# Altium project Force_Measurement_Device_PCB.PrjPcb
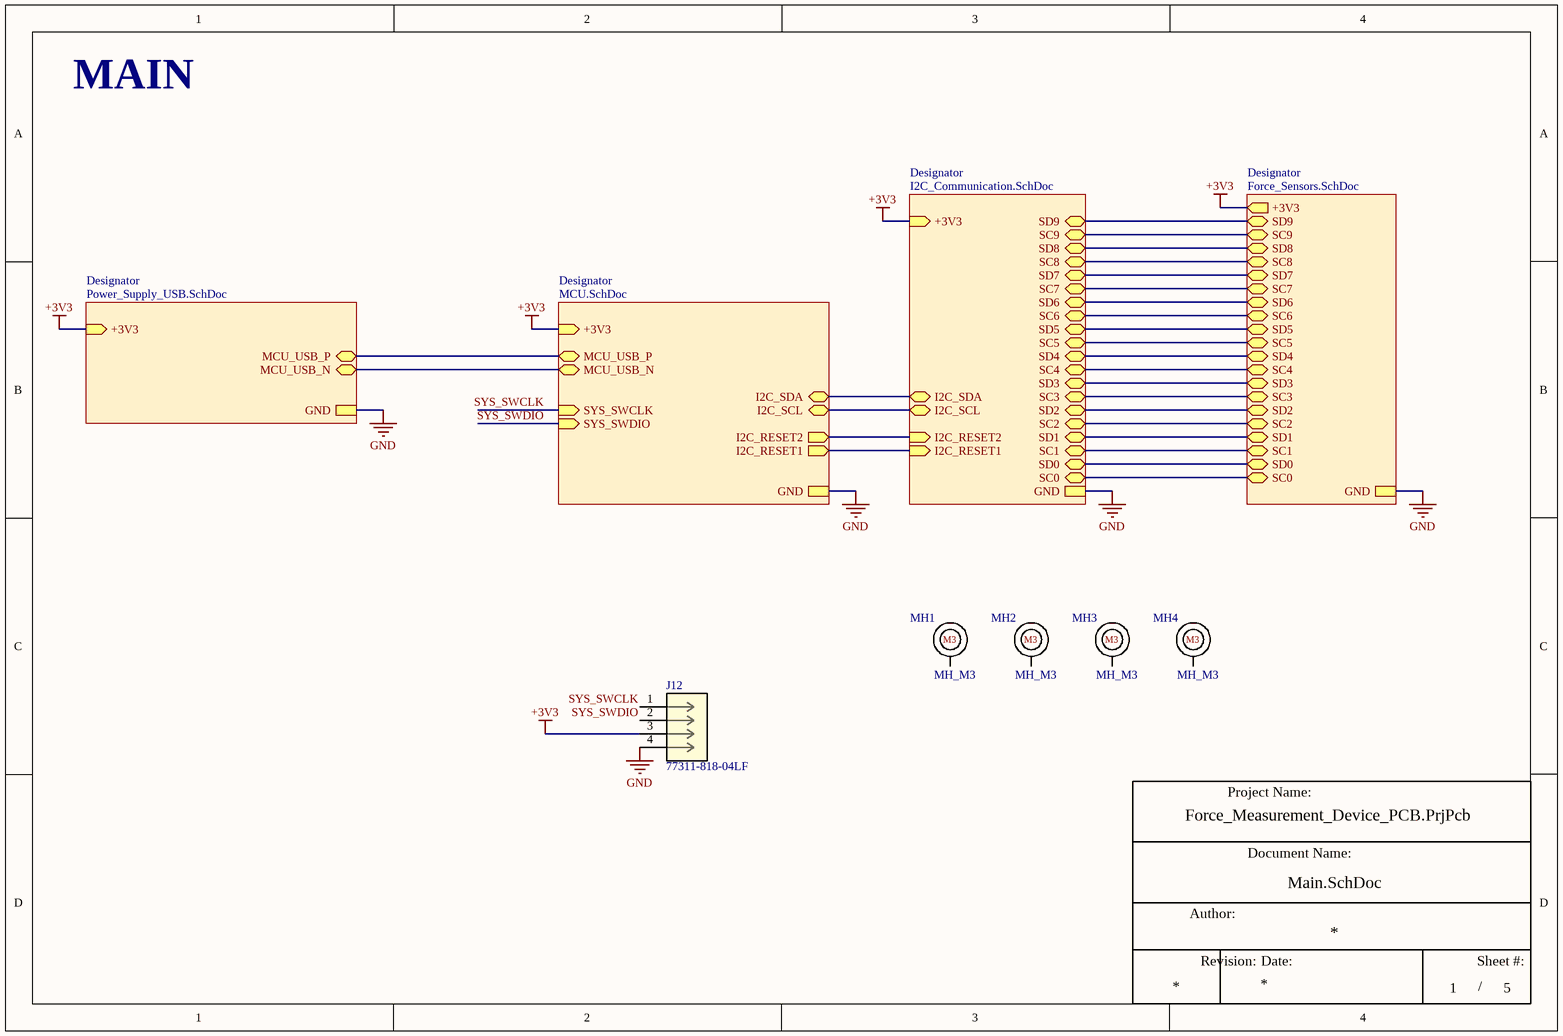
[diagram p0: Main.SchDoc]
CAGE_CODE: ?????; CONTRACT_NUMBER: <CONTRACT NO>; DOC_NO_ASSY_DWG: <ASSY DWG NO>; DOC_NO_BOM: <BOM DOC NO>; DOC_NO_FAB_DWG: <FAB DWG NO>; DOC_NO_SCH_DWG: <SCH DWG NO>; PCB_2_DEC_TOL: +/-.01; PCB_3_DEC_TOL: +/-.010; PCB_ANG_TOL: +/-1/2; PCB_ASSEMBLY_NO: <PCB ASSY NO>; PCB_CHECKER: - -----; PCB_CHECKER_APP_DATE: --/--/----; PCB_DESIGNER: - -----; PCB_DESIGNER_APP_DATE: --/--/----; PCB_DWG_NO: <PCB DWG NO>; PCB_ENGINEER: - -----; PCB_ENGINEER_APP_DATE: --/--/----; PCB_PART_NUMBER: <PCB PN>; PCB_REV: A; SCH_REV: A
5 sheets, 117 parts. Net scope: strictly hierarchical (ports join the sheet entries above them; power ports are local).
Board file: PCB1.PcbDoc
Sheets:
  Main.SchDoc
    Designator = Force_Sensors.SchDoc
    Designator = Power_Supply_USB.SchDoc
    Designator = MCU.SchDoc
    Designator = I2C_Communication.SchDoc

## Sheet Main.SchDoc
size A4; SheetNumber: 1; SheetTotal: 5

### Parts
J12  77311-818-04LF  [77311-818-04LF_AMP]
MH1  MH_M3  [M3]  (no BOM)
MH2  MH_M3  [M3]  (no BOM)
MH3  MH_M3  [M3]  (no BOM)
MH4  MH_M3  [M3]  (no BOM)

### Sub-sheets
Designator = Force_Sensors.SchDoc: GND, +3V3 (out), SC9 (bidir), SD8 (bidir), SC8 (bidir), SD7 (bidir), SC7 (bidir), SD6 (bidir), SC6 (bidir), SD5 (bidir), SC5 (bidir), SD4 (bidir), SC4 (bidir), SD3 (bidir), SC3 (bidir), SD2 (bidir), SC2 (bidir), SD1 (bidir), SC1 (bidir), SD0 (bidir), SC0 (bidir), SD9 (bidir)
Designator = Power_Supply_USB.SchDoc: GND, +3V3 (in), MCU_USB_P (bidir), MCU_USB_N (bidir)
Designator = MCU.SchDoc: I2C_SDA (bidir), I2C_SCL (bidir), SYS_SWCLK (in), +3V3 (in), SYS_SWDIO (in), I2C_RESET1 (out), I2C_RESET2 (out), GND, MCU_USB_P (bidir), MCU_USB_N (bidir)
Designator = I2C_Communication.SchDoc: GND, +3V3 (in), I2C_SDA (bidir), I2C_SCL (bidir), I2C_RESET2 (in), I2C_RESET1 (in), SC9 (bidir), SD8 (bidir), SC8 (bidir), SD2 (bidir), SD7 (bidir), SC3 (bidir), SD3 (bidir), SC4 (bidir), SD4 (bidir), SC5 (bidir), SD5 (bidir), SC6 (bidir), SD6 (bidir), SC7 (bidir), SC2 (bidir), SD1 (bidir), SC1 (bidir), SD0 (bidir), SC0 (bidir), SD9 (bidir)

### Nets
+3V3: J12.3 ; sheet Designator/+3V3, sheet Designator/+3V3, sheet Designator/+3V3, sheet Designator/+3V3
GND: J12.4 ; sheet Designator/GND, sheet Designator/GND, sheet Designator/GND, sheet Designator/GND
I2C_RESET1: sheet Designator/I2C_RESET1, sheet Designator/I2C_RESET1
I2C_RESET2: sheet Designator/I2C_RESET2, sheet Designator/I2C_RESET2
I2C_SCL: sheet Designator/I2C_SCL, sheet Designator/I2C_SCL
I2C_SDA: sheet Designator/I2C_SDA, sheet Designator/I2C_SDA
MCU_USB_N: sheet Designator/MCU_USB_N, sheet Designator/MCU_USB_N
MCU_USB_P: sheet Designator/MCU_USB_P, sheet Designator/MCU_USB_P
SC0: sheet Designator/SC0, sheet Designator/SC0
SC1: sheet Designator/SC1, sheet Designator/SC1
SC2: sheet Designator/SC2, sheet Designator/SC2
SC3: sheet Designator/SC3, sheet Designator/SC3
SC4: sheet Designator/SC4, sheet Designator/SC4
SC5: sheet Designator/SC5, sheet Designator/SC5
SC6: sheet Designator/SC6, sheet Designator/SC6
SC7: sheet Designator/SC7, sheet Designator/SC7
SC8: sheet Designator/SC8, sheet Designator/SC8
SC9: sheet Designator/SC9, sheet Designator/SC9
SD0: sheet Designator/SD0, sheet Designator/SD0
SD1: sheet Designator/SD1, sheet Designator/SD1
SD2: sheet Designator/SD2, sheet Designator/SD2
SD3: sheet Designator/SD3, sheet Designator/SD3
SD4: sheet Designator/SD4, sheet Designator/SD4
SD5: sheet Designator/SD5, sheet Designator/SD5
SD6: sheet Designator/SD6, sheet Designator/SD6
SD7: sheet Designator/SD7, sheet Designator/SD7
SD8: sheet Designator/SD8, sheet Designator/SD8
SD9: sheet Designator/SD9, sheet Designator/SD9
SYS_SWCLK: J12.1 ; sheet Designator/SYS_SWCLK
SYS_SWDIO: J12.2 ; sheet Designator/SYS_SWDIO

Not connected (* = marked no-connect by the designer): MH1 1; MH2 1; MH3 1; MH4 1

### Notes on the sheet
- MAIN
- Project Name:
- Author:
- Document Name:
- Revision:
- Date:
- Sheet #:
- /

### Library data of the parts
J12 = 77311-818-04LF: Description; Manufacturer_Name: Amphenol ICC; Copyright: Copyright (C) 2025 Ultra Librarian. All rights reserved.; Manufacturer_Part_Number: 77311-818-04LF; RefDes: RefDes; Type: Type
MH1-MH4 = CMP-00028-00002-1: Mounting hole; M3 Screw; 3.4mm x 4.3mm; Revision Num.: 1; Man. Part Num.: M3; Diameter: 4.3mm; Hole size: 3.4mm

## Sheet Force_Sensors.SchDoc
size A4; SheetNumber: 4; SheetTotal: 5
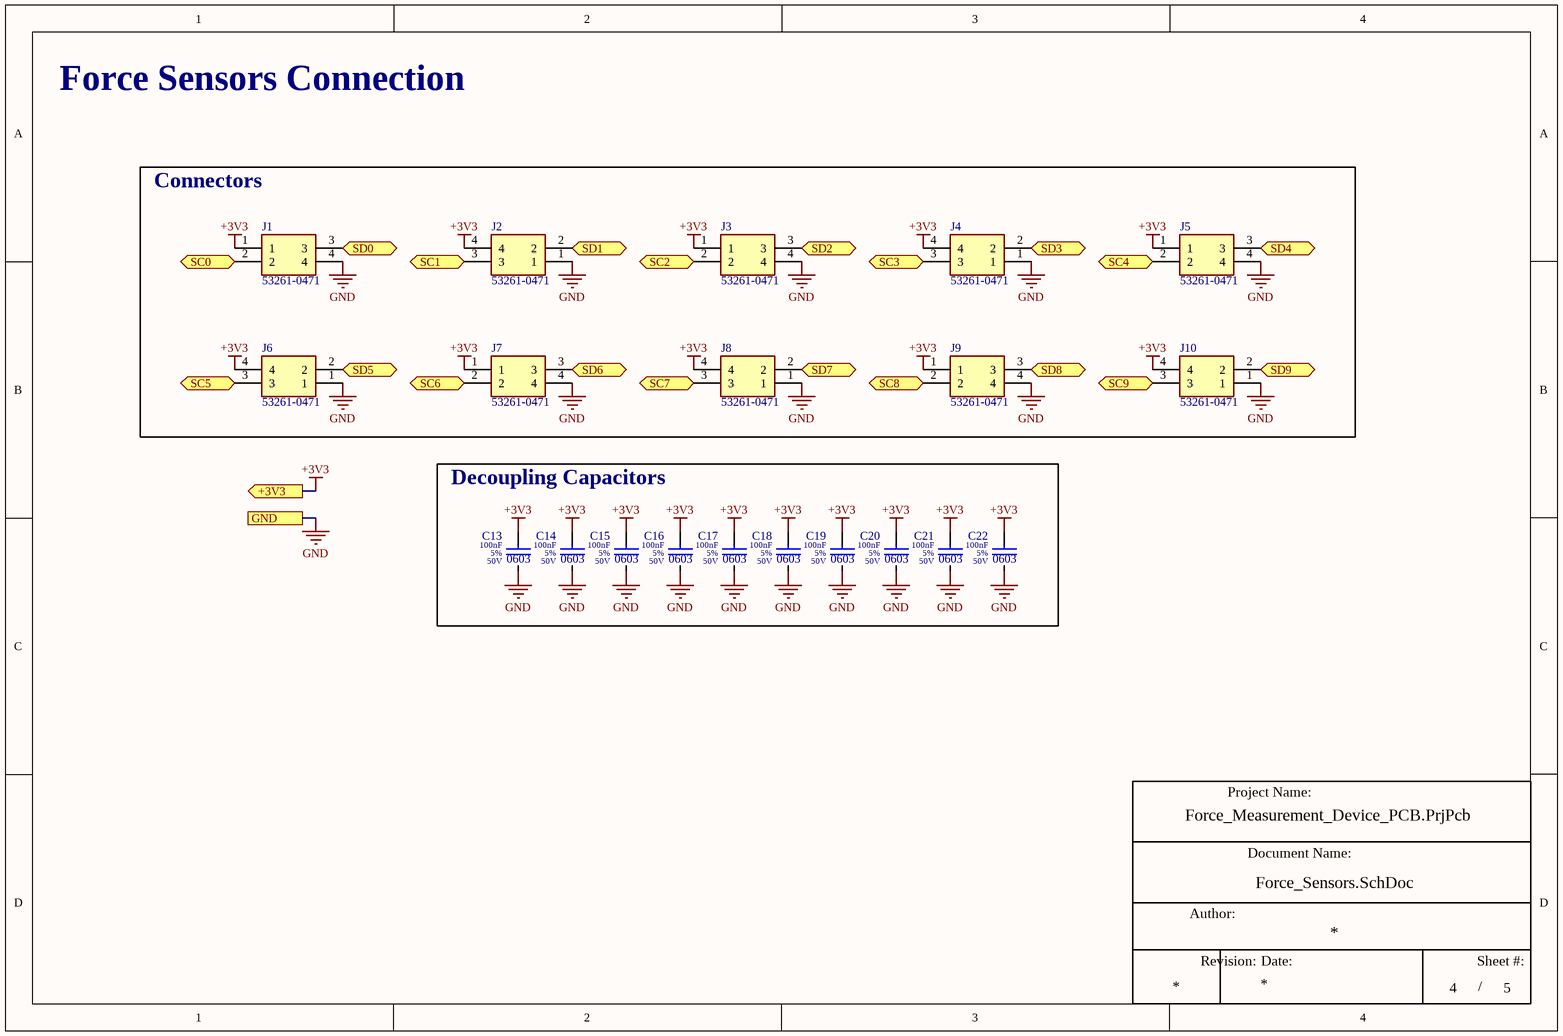
[diagram p1: Force_Sensors.SchDoc]

### Parts
C13  value 100nF  Tolerance: 5%  Voltage Rating: 50V  Case/Package: 0603  [0603_Capacitor]  (hidden comment: C_100n_50V_0603_5)
C14  value 100nF  Tolerance: 5%  Voltage Rating: 50V  Case/Package: 0603  [0603_Capacitor]  (hidden comment: C_100n_50V_0603_5)
C15  value 100nF  Tolerance: 5%  Voltage Rating: 50V  Case/Package: 0603  [0603_Capacitor]  (hidden comment: C_100n_50V_0603_5)
C16  value 100nF  Tolerance: 5%  Voltage Rating: 50V  Case/Package: 0603  [0603_Capacitor]  (hidden comment: C_100n_50V_0603_5)
C17  value 100nF  Tolerance: 5%  Voltage Rating: 50V  Case/Package: 0603  [0603_Capacitor]  (hidden comment: C_100n_50V_0603_5)
C18  value 100nF  Tolerance: 5%  Voltage Rating: 50V  Case/Package: 0603  [0603_Capacitor]  (hidden comment: C_100n_50V_0603_5)
C19  value 100nF  Tolerance: 5%  Voltage Rating: 50V  Case/Package: 0603  [0603_Capacitor]  (hidden comment: C_100n_50V_0603_5)
C20  value 100nF  Tolerance: 5%  Voltage Rating: 50V  Case/Package: 0603  [0603_Capacitor]  (hidden comment: C_100n_50V_0603_5)
C21  value 100nF  Tolerance: 5%  Voltage Rating: 50V  Case/Package: 0603  [0603_Capacitor]  (hidden comment: C_100n_50V_0603_5)
C22  value 100nF  Tolerance: 5%  Voltage Rating: 50V  Case/Package: 0603  [0603_Capacitor]  (hidden comment: C_100n_50V_0603_5)
J1  53261-0471  [53261-0471]
J2  53261-0471  [53261-0471]
J3  53261-0471  [53261-0471]
J4  53261-0471  [53261-0471]
J5  53261-0471  [53261-0471]
J6  53261-0471  [53261-0471]
J7  53261-0471  [53261-0471]
J8  53261-0471  [53261-0471]
J9  53261-0471  [53261-0471]
J10  53261-0471  [53261-0471]

### Blocks framed on the sheet
Connectors: J1-J10
Decoupling Capacitors: C13-C22

### Ports
+3V3 (out), GND, SC0 (bidir), SC1 (bidir), SC2 (bidir), SC3 (bidir), SC4 (bidir), SC5 (bidir), SC6 (bidir), SC7 (bidir), SC8 (bidir), SC9 (bidir), SD0 (bidir), SD1 (bidir), SD2 (bidir), SD3 (bidir), SD4 (bidir), SD5 (bidir), SD6 (bidir), SD7 (bidir), SD8 (bidir), SD9 (bidir)

### Nets
+3V3: C13.1 C14.1 C15.1 C16.1 C17.1 C18.1 C19.1 C20.1 C21.1 C22.1 J1.1 J2.4 J3.1 J4.4 J5.1 J6.4 J7.1 J8.4 J9.1 J10.4 ; port +3V3
GND: C13.2 C14.2 C15.2 C16.2 C17.2 C18.2 C19.2 C20.2 C21.2 C22.2 J1.4 J2.1 J3.4 J4.1 J5.4 J6.1 J7.4 J8.1 J9.4 J10.1 ; port GND
SC0: J1.2 ; port SC0
SC1: J2.3 ; port SC1
SC2: J3.2 ; port SC2
SC3: J4.3 ; port SC3
SC4: J5.2 ; port SC4
SC5: J6.3 ; port SC5
SC6: J7.2 ; port SC6
SC7: J8.3 ; port SC7
SC8: J9.2 ; port SC8
SC9: J10.3 ; port SC9
SD0: J1.3 ; port SD0
SD1: J2.2 ; port SD1
SD2: J3.3 ; port SD2
SD3: J4.2 ; port SD3
SD4: J5.3 ; port SD4
SD5: J6.2 ; port SD5
SD6: J7.3 ; port SD6
SD7: J8.2 ; port SD7
SD8: J9.3 ; port SD8
SD9: J10.2 ; port SD9

### Notes on the sheet
- Force Sensors Connection
- Project Name:
- Author:
- Document Name:
- Revision:
- Date:
- Sheet #:
- /

### Library data of the parts
C13-C22 = CMP-001-00008-27: Capacitor Type: Ceramic; Revision Num.: 1; HelpURL: https://www.tme.eu/Document/78f46414e6dac38b7cca12338ea208b0/X7RDielectric.pdf; Mounting Technology: SMT
J1-J10 = 53261-0471: Connector; Manufacturer_Name: Molex; Datasheet Link: http://www.molex.com/webdocs/datasheets/pdf/en-us//0532610471_PCB_HEADERS.pdf; Manufacturer_Part_Number: 53261-0471; Mouser Part Number: 538-53261-0471; Mouser Price/Stock: https://www.mouser.co.uk/ProductDetail/Molex/53261-0471?qs=%252B72YyncTwW9e3et3PwnEMw%3D%3D; Arrow Part Number: 53261-0471; Arrow Price/Stock: null?region=nac

## Sheet Power_Supply_USB.SchDoc
size A4; SheetNumber: 5; SheetTotal: 5
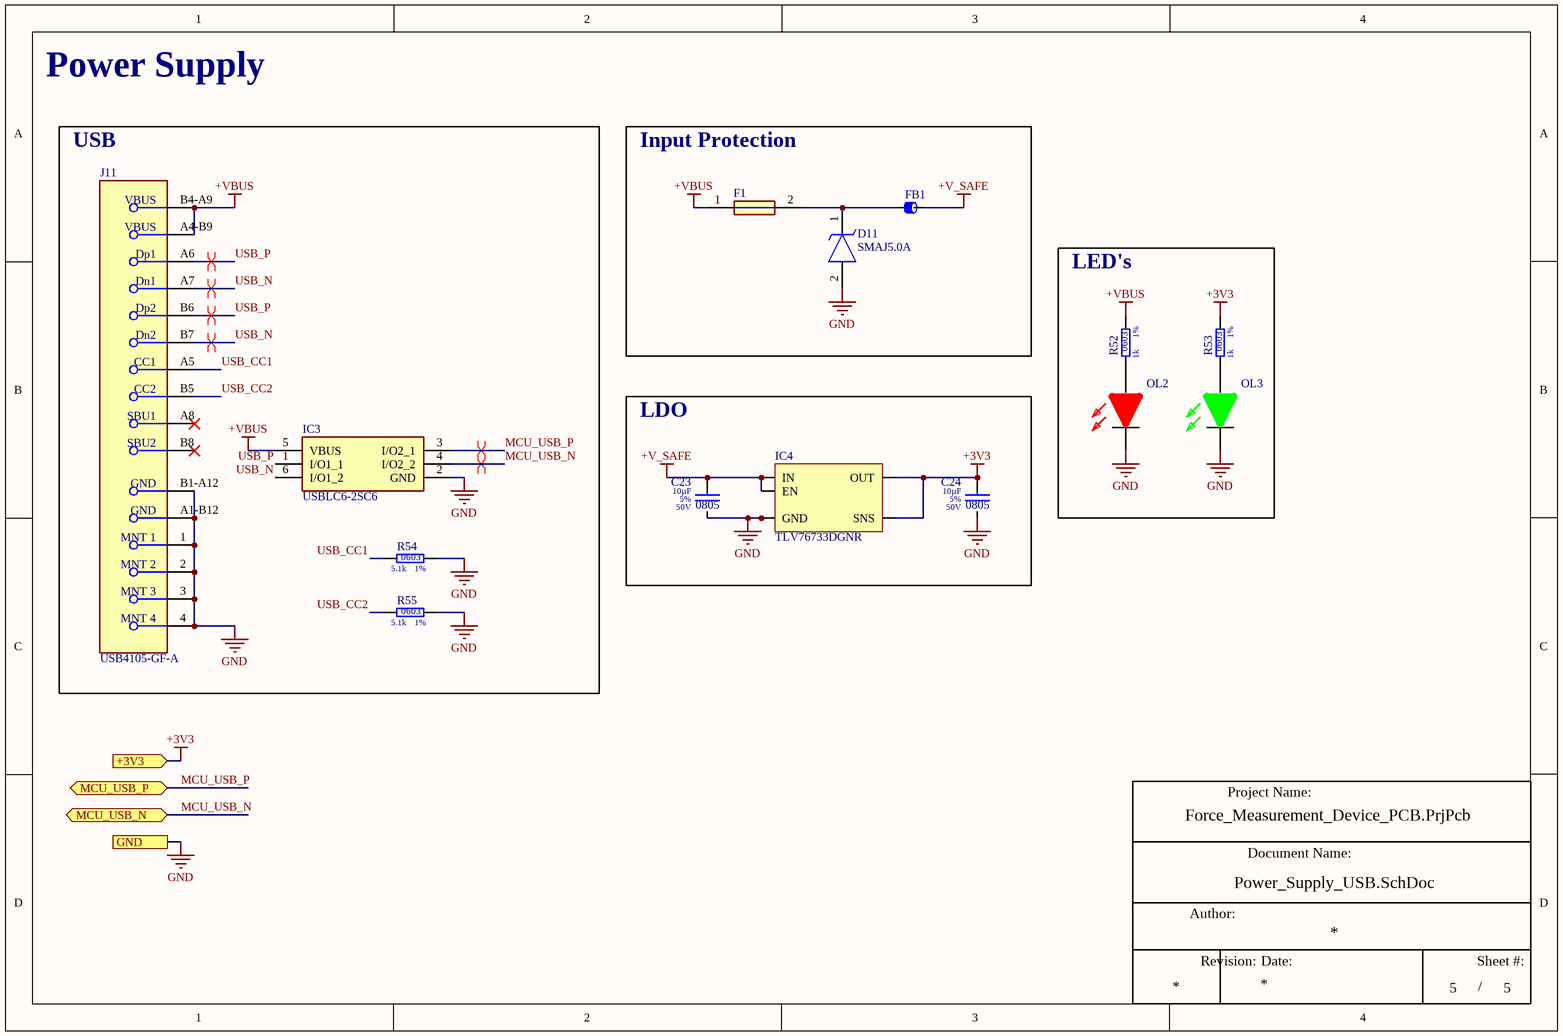
[diagram p2: Power_Supply_USB.SchDoc]

### Parts
C23  value 10µF  Tolerance: 5%  Voltage Rating: 50V  Case/Package: 0805  [0805_Capacitor]  (hidden comment: C_10u_50V_0805_10)
C24  value 10µF  Tolerance: 5%  Voltage Rating: 50V  Case/Package: 0805  [0805_Capacitor]  (hidden comment: C_10u_50V_0805_10)
D11  SMAJ5.0A  [DIOM5226X243N]
F1  1206L050_15YR  [FUSC3216X75N]  (value not drawn)
FB1  MPZ1608S601ATA00  [BEADC1608X75N]  (value not drawn)
IC3  USBLC6-2SC6  [SOT95P280X145-6N]
IC4  TLV76733DGNR  [SOP65P490X110-9N]
J11  USB4105-GF-A  [USB_C]
OL2  SML-LX0603SIW-TR  [LEDC1608X60N]  (value not drawn)
OL3  SML-LX0603GW-TR  [LEDC1608X60N]  (value not drawn)
R52  Tolerance: 1%  Resistance: 1k  Case/Package: 0603  [0603_Resistor]  (hidden comment: R_1k_0603_1)
R53  Tolerance: 1%  Resistance: 1k  Case/Package: 0603  [0603_Resistor]  (hidden comment: R_1k_0603_1)
R54  Tolerance: 1%  Resistance: 5.1k  Case/Package: 0603  [0603_Resistor]  (hidden comment: R_5k1_0603_5)
R55  Tolerance: 1%  Resistance: 5.1k  Case/Package: 0603  [0603_Resistor]  (hidden comment: R_5k1_0603_5)

### Blocks framed on the sheet
USB: IC3 J11 R54 R55
Input Protection: D11 F1 FB1
LED's: OL2 OL3 R52 R53
LDO: C23 C24 IC4

### Ports
+3V3 (in), GND, MCU_USB_N (bidir), MCU_USB_P (bidir)

### Nets
+3V3: C24.1 IC4.1(OUT) IC4.2(SNS) R53.2 ; port +3V3
+V_SAFE: C23.1 FB1.2 IC4.5(EN) IC4.8(IN)
+VBUS: F1.1 IC3.5(VBUS) J11.A4-B9(VBUS) J11.B4-A9(VBUS) R52.2
GND: C23.2 C24.2 D11.2(A) IC3.2(GND) IC4.4(GND_2) IC4.6(GND) IC4.9(EP) J11.1(MNT_1) J11.2(MNT_2) J11.3(MNT_3) J11.4(MNT_4) J11.A1-B12(GND) J11.B1-A12(GND) OL2.1(K) OL3.1(K) R54.2 R55.2 ; port GND
MCU_USB_N: IC3.4(I/O2_2) ; port MCU_USB_N
MCU_USB_P: IC3.3(I/O2_1) ; port MCU_USB_P
USB_CC1: J11.A5(CC1) R54.1
USB_CC2: J11.B5(CC2) R55.1
USB_N: IC3.6(I/O1_2) J11.A7(Dn1) J11.B7(Dn2)
USB_P: IC3.1(I/O1_1) J11.A6(Dp1) J11.B6(Dp2)
NetD11_1: D11.1(K) F1.2 FB1.1
NetOL2_2: OL2.2(A) R52.1
NetOL3_2: OL3.2(A) R53.1

Not connected (* = marked no-connect by the designer): J11 A8(SBU1)* B8(SBU2)*

### Layout directives
differential pair: MCU_USB_N, MCU_USB_P, USB_N, USB_P

### Notes on the sheet
- Power Supply
- Project Name:
- Author:
- Document Name:
- Revision:
- Date:
- Sheet #:
- /

### Library data of the parts
C23 C24 = CMP-001-00003-17: Man. Part Num.: GRM21BR61H106KE43L; Revision Num.: 1; Capacitor Type: Ceramic; HelpURL: https://www.mouser.pl/datasheet/2/281/1/GRM21BR61H106KE43_01A-1986884.pdf; Mounting Technology: SMT
D11 = SMAJ5.0A: TVS Diode (Uni-directional); Manufacturer_Name: Kyocera AVX; Datasheet Link: http://datasheets.kyocera-avx.com/tvsdiodes.pdf; Height: 2.43mm; Manufacturer_Part_Number: SMAJ5.0A; Mouser Part Number: 581-SMAJ5.0A; Mouser Price/Stock: https://www.mouser.co.uk/ProductDetail/KYOCERA-AVX/SMAJ5.0A?qs=tuYJFV7zqWuCnk6fJgfdVg%3D%3D; Arrow Part Number: SMAJ5.0A; Arrow Price/Stock: null?region=nac
F1 = 1206L050_15YR: Fuse; Manufacturer_Name: Wickmann; Manufacturer_Part_Number: 1206L050/15YR; Datasheet Link: https://docs.rs-online.com/8c7c/0900766b81637964.pdf; Height: 0.75mm
FB1 = MPZ1608S601ATA00: Ferrite Bead; Manufacturer_Name: TDK; Datasheet Link: https://product.tdk.com/system/files/dam/doc/product/emc/emc/beads/catalog/beads_commercial_power_mpz1608_en.pdf; Height: 0.75mm; Manufacturer_Part_Number: MPZ1608S601ATA00; Mouser Part Number: 810-MPZ1608S601ATA00; Mouser Price/Stock: https://www.mouser.co.uk/ProductDetail/TDK/MPZ1608S601ATA00?qs=47dIwT2ZIzth0CTKDYh9rw%3D%3D; Arrow Part Number: MPZ1608S601ATA00; Arrow Price/Stock: https://www.arrow.com/en/products/mpz1608s601ata00/tdk.html?utm_currency=USD&region=europe
IC3 = USBLC6-2SC6: Integrated Circuit; Manufacturer_Name: STMicroelectronics; Datasheet Link: https://www.st.com/resource/en/datasheet/usblc6-2.pdf; Height: 1.45mm; Manufacturer_Part_Number: USBLC6-2SC6; Mouser Part Number: 511-USBLC6-2SC6; Mouser Price/Stock: https://www.mouser.co.uk/ProductDetail/STMicroelectronics/USBLC6-2SC6?qs=po45yt2pPpu%2FhNIlwQdTlg%3D%3D; Arrow Part Number: USBLC6-2SC6; Arrow Price/Stock: https://www.arrow.com/en/products/usblc6-2sc6/stmicroelectronics?utm_currency=USD&region=europe
IC4 = TLV76733DGNR: Integrated Circuit; Manufacturer_Name: Texas Instruments; Datasheet Link: https://www.ti.com/lit/ds/symlink/tlv767.pdf?ts=1601893180135&ref_url=https%253A%252F%252Fduckduckgo.com%252F; Height: 1.1mm; Manufacturer_Part_Number: TLV76733DGNR; Mouser Part Number: 595-TLV76733DGNR; Mouser Price/Stock: https://www.mouser.co.uk/ProductDetail/Texas-Instruments/TLV76733DGNR?qs=W%2FMpXkg%252BdQ7WCurh%2FfEdlw%3D%3D; Arrow Part Number: TLV76733DGNR; Arrow Price/Stock: https://www.arrow.com/en/products/tlv76733dgnr/texas-instruments?utm_currency=USD&region=nac
J11 = USB_C: USB Connector Type-C, 16 Contact(s), Female, Right Angle, SMT, USB 2.0
OL2 = SML-LX0603SIW-TR: LED; Manufacturer_Name: Lumex; Datasheet Link: https://www.lumex.com/led-smd-0603.html; Height: 0.6mm; Manufacturer_Part_Number: SML-LX0603SIW-TR; Mouser Part Number: 696-SML-LX0603SIW; Mouser Price/Stock: https://www.mouser.co.uk/ProductDetail/Lumex/SML-LX0603SIW-TR?qs=lPH1AmYLb0ytkrMTawxMgQ%3D%3D; Arrow Part Number: SML-LX0603SIW-TR; Arrow Price/Stock: https://www.arrow.com/en/products/sml-lx0603siw-tr/lumex?utm_currency=USD&region=nac
OL3 = SML-LX0603GW-TR: LED; Manufacturer_Name: Lumex; Datasheet Link: https://www.lumex.com/datasheet/SML-LX0603GW-TR; Height: 0.727mm; Manufacturer_Part_Number: SML-LX0603GW-TR; Mouser Part Number: N/A; Mouser Price/Stock: https://www.mouser.com/Search/Refine.aspx?Keyword=N%2FA; Arrow Part Number: SML-LX0603GW-TR; Arrow Price/Stock: https://www.arrow.com/en/products/sml-lx0603gw-tr/lumex?utm_currency=USD&region=nac
R52 R53 = CMP-009-00099-4: Revision Num.: 1; Voltage Rating: 75V; Power: 100mW; HelpURL: https://www.tme.eu/Document/622e28308c06d160637f2b14751ba16b/Data%20Sheet%20CRCW_BCe3.pdf; Mounting Technology: SMT
R54 R55 = CMP-009-00017-19: Revision Num.: 1; Power: 100mW; Voltage Rating: 50V; HelpURL: https://www.mouser.pl/datasheet/2/54/cr-1858361.pdf; Mounting Technology: SMT

## Sheet MCU.SchDoc
size A4; SheetNumber: 2; SheetTotal: 5; ENG_APP_DATE: --/--/--; DSN_APP_DATE: --/--/--; CHK_APP_DATE: --/--/--
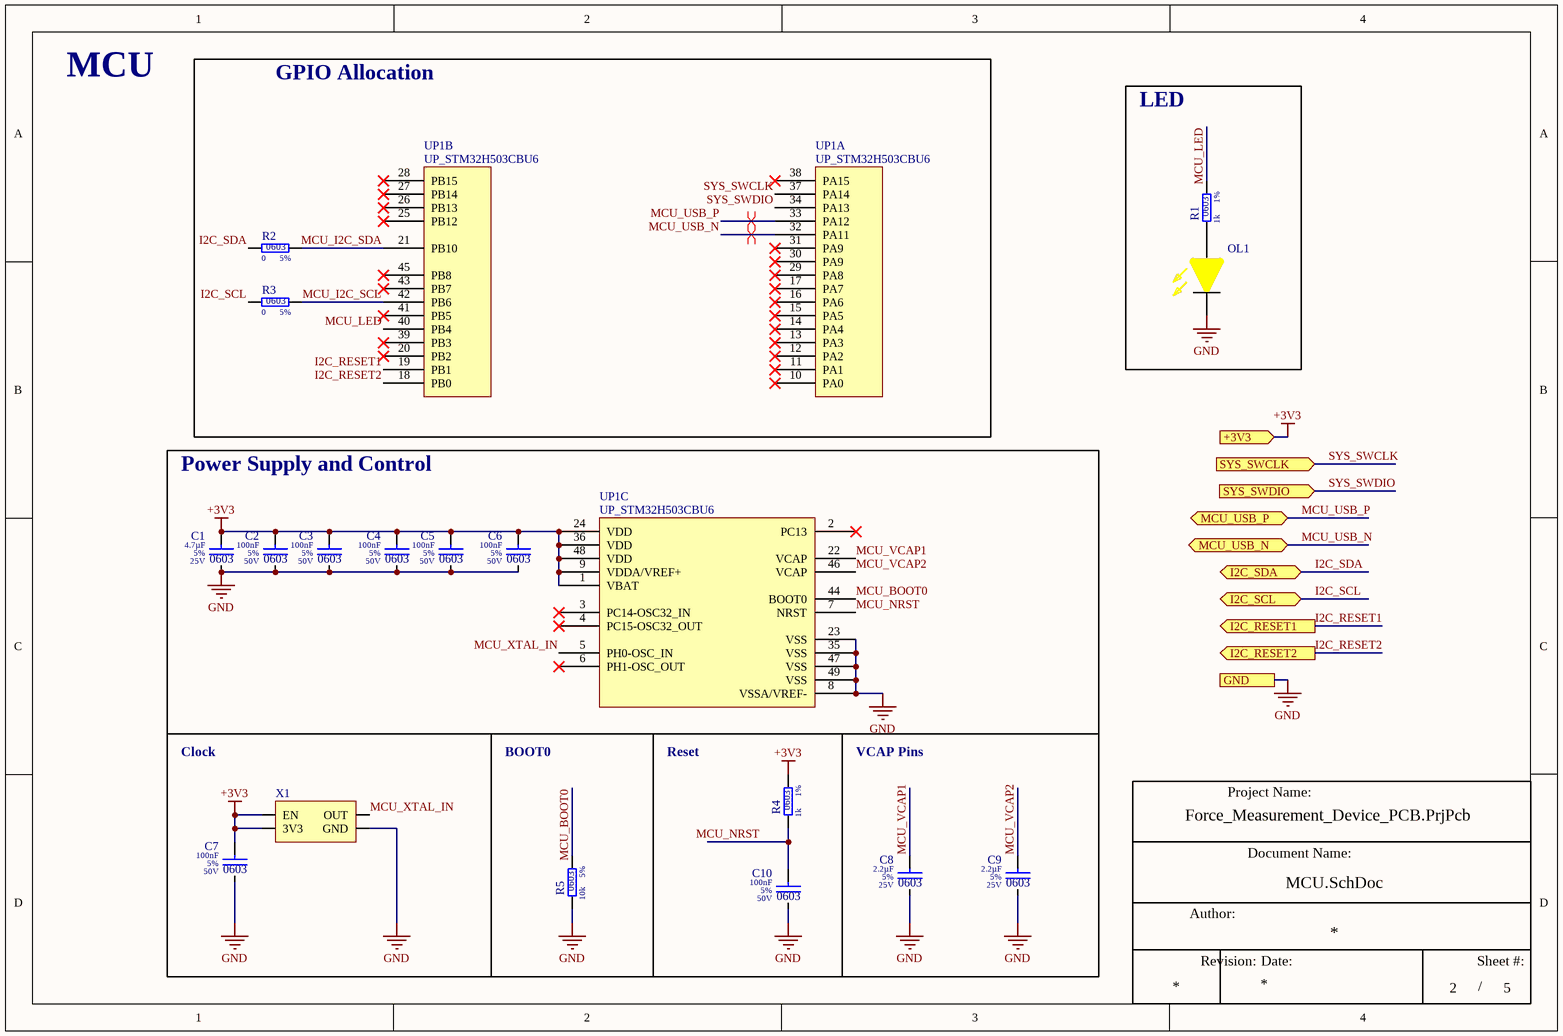
[diagram p3: MCU.SchDoc]

### Parts
C1  value 4.7µF  Tolerance: 5%  Voltage Rating: 25V  Case/Package: 0603  [0603_Capacitor]  (hidden comment: C_4.7u_25V_0603_5)
C2  value 100nF  Tolerance: 5%  Voltage Rating: 50V  Case/Package: 0603  [0603_Capacitor]  (hidden comment: C_100n_50V_0603_5)
C3  value 100nF  Tolerance: 5%  Voltage Rating: 50V  Case/Package: 0603  [0603_Capacitor]  (hidden comment: C_100n_50V_0603_5)
C4  value 100nF  Tolerance: 5%  Voltage Rating: 50V  Case/Package: 0603  [0603_Capacitor]  (hidden comment: C_100n_50V_0603_5)
C5  value 100nF  Tolerance: 5%  Voltage Rating: 50V  Case/Package: 0603  [0603_Capacitor]  (hidden comment: C_100n_50V_0603_5)
C6  value 100nF  Tolerance: 5%  Voltage Rating: 50V  Case/Package: 0603  [0603_Capacitor]  (hidden comment: C_100n_50V_0603_5)
C7  value 100nF  Tolerance: 5%  Voltage Rating: 50V  Case/Package: 0603  [0603_Capacitor]  (hidden comment: C_100n_50V_0603_5)
C8  value 2.2µF  Tolerance: 5%  Voltage Rating: 25V  Case/Package: 0603  [0603_Capacitor]  (hidden comment: C_2.2u_25V_0603_5)
C9  value 2.2µF  Tolerance: 5%  Voltage Rating: 25V  Case/Package: 0603  [0603_Capacitor]  (hidden comment: C_2.2u_25V_0603_5)
C10  value 100nF  Tolerance: 5%  Voltage Rating: 50V  Case/Package: 0603  [0603_Capacitor]  (hidden comment: C_100n_50V_0603_5)
OL1  SML-LX0603SYW-TR  [LEDC1608X60N]  (value not drawn)
R1  Tolerance: 1%  Resistance: 1k  Case/Package: 0603  [0603_Resistor]  (hidden comment: R_1k_0603_1)
R2  Tolerance: 5%  Resistance: 0  Case/Package: 0603  [0603_Resistor]  (hidden comment: R_0_0603_5)
R3  Tolerance: 5%  Resistance: 0  Case/Package: 0603  [0603_Resistor]  (hidden comment: R_0_0603_5)
R4  Tolerance: 1%  Resistance: 1k  Case/Package: 0603  [0603_Resistor]  (hidden comment: R_1k_0603_1)
R5  Tolerance: 5%  Resistance: 10k  Case/Package: 0603  [0603_Resistor]  (hidden comment: R_10k_0603_5)
UP1  UP_STM32H503CBU6  [UFQFPN48]  (parts A,B,C of 3)
X1  X_16MHz_LFSPXO066657CUTT  [X_2mm_2.5mm_oscillator]  (value not drawn)

### Blocks framed on the sheet
GPIO Allocation: R2 R3 UP1
LED: OL1 R1
Power Supply and Control: C1-C10 R4 R5 UP1 X1

### Ports
+3V3 (in), GND, I2C_RESET1 (out), I2C_RESET2 (out), I2C_SCL (bidir), I2C_SDA (bidir), MCU_USB_N (bidir), MCU_USB_P (bidir), SYS_SWCLK (in), SYS_SWDIO (in)

### Nets
+3V3: C1.1 C2.1 C3.1 C4.1 C5.1 C6.1 C7.1 R4.2 UP1.1(VBAT) UP1.9(VDDA/VREF+) UP1.24(VDD) UP1.36(VDD) UP1.48(VDD) X1.1(EN) X1.4(3V3) ; port +3V3
GND: C1.2 C2.2 C3.2 C4.2 C5.2 C6.2 C7.2 C8.2 C9.2 C10.2 OL1.1(K) R5.1 UP1.8(VSSA/VREF-) UP1.23(VSS) UP1.35(VSS) UP1.47(VSS) UP1.49(VSS) X1.2(GND) ; port GND
I2C_RESET1: UP1.19(PB1) ; port I2C_RESET1
I2C_RESET2: UP1.18(PB0) ; port I2C_RESET2
I2C_SCL: R3.1 ; port I2C_SCL
I2C_SDA: R2.1 ; port I2C_SDA
MCU_BOOT0: R5.2 UP1.44(BOOT0)
MCU_I2C_SCL: R3.2 UP1.42(PB6)
MCU_I2C_SDA: R2.2 UP1.21(PB10)
MCU_LED: R1.2 UP1.40(PB4)
MCU_NRST: C10.1 R4.1 UP1.7(NRST)
MCU_USB_N: UP1.32(PA11) ; port MCU_USB_N
MCU_USB_P: UP1.33(PA12) ; port MCU_USB_P
MCU_VCAP1: C8.1 UP1.22(VCAP)
MCU_VCAP2: C9.1 UP1.46(VCAP)
MCU_XTAL_IN: UP1.5(PH0-OSC_IN) X1.3(OUT)
SYS_SWCLK: UP1.37(PA14) ; port SYS_SWCLK
SYS_SWDIO: UP1.34(PA13) ; port SYS_SWDIO
NetOL1_2: OL1.2(A) R1.1

Not connected (* = marked no-connect by the designer): UP1 2(PC13)* 3(PC14-OSC32_IN)* 4(PC15-OSC32_OUT)* 6(PH1-OSC_OUT)* 10(PA0)* 11(PA1)* 12(PA2)* 13(PA3)* 14(PA4)* 15(PA5)* 16(PA6)* 17(PA7)* 20(PB2)* 25(PB12)* 26(PB13)* 27(PB14)* 28(PB15)* 29(PA8)* 30(PA9)* 31(PA9)* 38(PA15)* 39(PB3)* 41(PB5)* 43(PB7)* 45(PB8)*

### Layout directives
differential pair: MCU_USB_N, MCU_USB_P

### Notes on the sheet
- MCU
- Clock
- BOOT0
- (near UP1) Reset
- VCAP Pins
- Project Name:
- Author:
- Document Name:
- Revision:
- Date:
- Sheet #:
- /

### Library data of the parts
C1 = CMP-001-00011-26: Revision Num.: 1; Capacitor Type: Ceramic; Mounting Technology: SMT; HelpURL: https://eu.mouser.com/datasheet/2/40/cx5r_KGM-3223198.pdf
C2-C7 C10 = CMP-001-00008-27: as C13 on sheet Force_Sensors; HelpURL: https://www.tme.eu/Document/78f46414e6dac38b7cca12338ea208b0/X7RDielectric.pdf; Mounting Technology: SMT
C8 C9 = CMP-001-00022-24: Capacitor Type: Ceramic; Revision Num.: 1; Mounting Technology: SMT; HelpURL: https://eu.mouser.com/datasheet/2/281/1/GRT188C71E225KE13_01A-3158366.pdf
OL1 = SML-LX0603SYW-TR: LED; Manufacturer_Name: Lumex; Datasheet Link: https://datasheet.datasheetarchive.com/originals/distributors/Datasheets-AE/DSA3AE0000479.pdf; Height: 0.85mm; Manufacturer_Part_Number: SML-LX0603SYW-TR; Mouser Part Number: 696-SML-LX0603SYW; Mouser Price/Stock: https://www.mouser.co.uk/ProductDetail/Lumex/SML-LX0603SYW-TR?qs=lPH1AmYLb0wIUT30EAX6ng%3D%3D; Arrow Part Number: SML-LX0603SYW-TR; Arrow Price/Stock: https://www.arrow.com/en/products/sml-lx0603syw-tr/lumex?utm_currency=USD&region=nac
R1 R4 = CMP-009-00099-4: as R52 on sheet Power_Supply_USB; HelpURL: https://www.tme.eu/Document/622e28308c06d160637f2b14751ba16b/Data%20Sheet%20CRCW_BCe3.pdf; Mounting Technology: SMT
R2 R3 = CMP-009-00016-20: Power: 100mW; Revision Num.: 1; Voltage Rating: 50V; Mounting Technology: SMT; HelpURL: https://www.tme.eu/Document/c283990e907c122bb808207d1578ac7f/POWER_RATING-DTE.pdf
R5 = CMP-009-00002-21: Power: 100mW; Revision Num.: 1; Voltage Rating: 50V; Mounting Technology: SMT; HelpURL: https://www.tme.eu/Document/d2a72e545e5c8eb7bf2a04fa97535928/rc0603yageo.pdf
UP1 = CMP-020-00035-2: MCU Arm Cortex-M33 32-bit 250MHz, 128 Kbytes of Flash, 32 Kbytes of RAM, I3C; Revision Num.: 1; ROM Size: 128kB; Max Supply Voltage: 3.6V; RAM Size: 32kB; Min Supply Voltage: 1.71V; Case/Package: UFQFPN32; HelpURL: https://www.st.com/resource/en/datasheet/stm32h503eb.pdf; Series: STM32H503xx; Mounting Technology: SMT; Clock Frequency: 250MHz; Pins: 48; Man. Part Num.: STM32H503CBU6
X1 = X_16MHz_LFSPXO066657CUTT-10: Quartz generator; 16MHz; 50ppm; SMT; Rated Supply Voltage: 3.3V; Revision Num.: 1; Frequency: 16MHz; Case/Package: 2.5mm x 2.1mm; Mounting Technology: SMT; Tolerance: 50ppm; HelpURL: https://www.tme.eu/Document/f2507c161887e0dea281275093e92f79/LFSPXO066657CUTT.pdf; Man. Part Num.: LFSPXO066657CUTT

## Sheet I2C_Communication.SchDoc
size A4; SheetNumber: 3; SheetTotal: 5
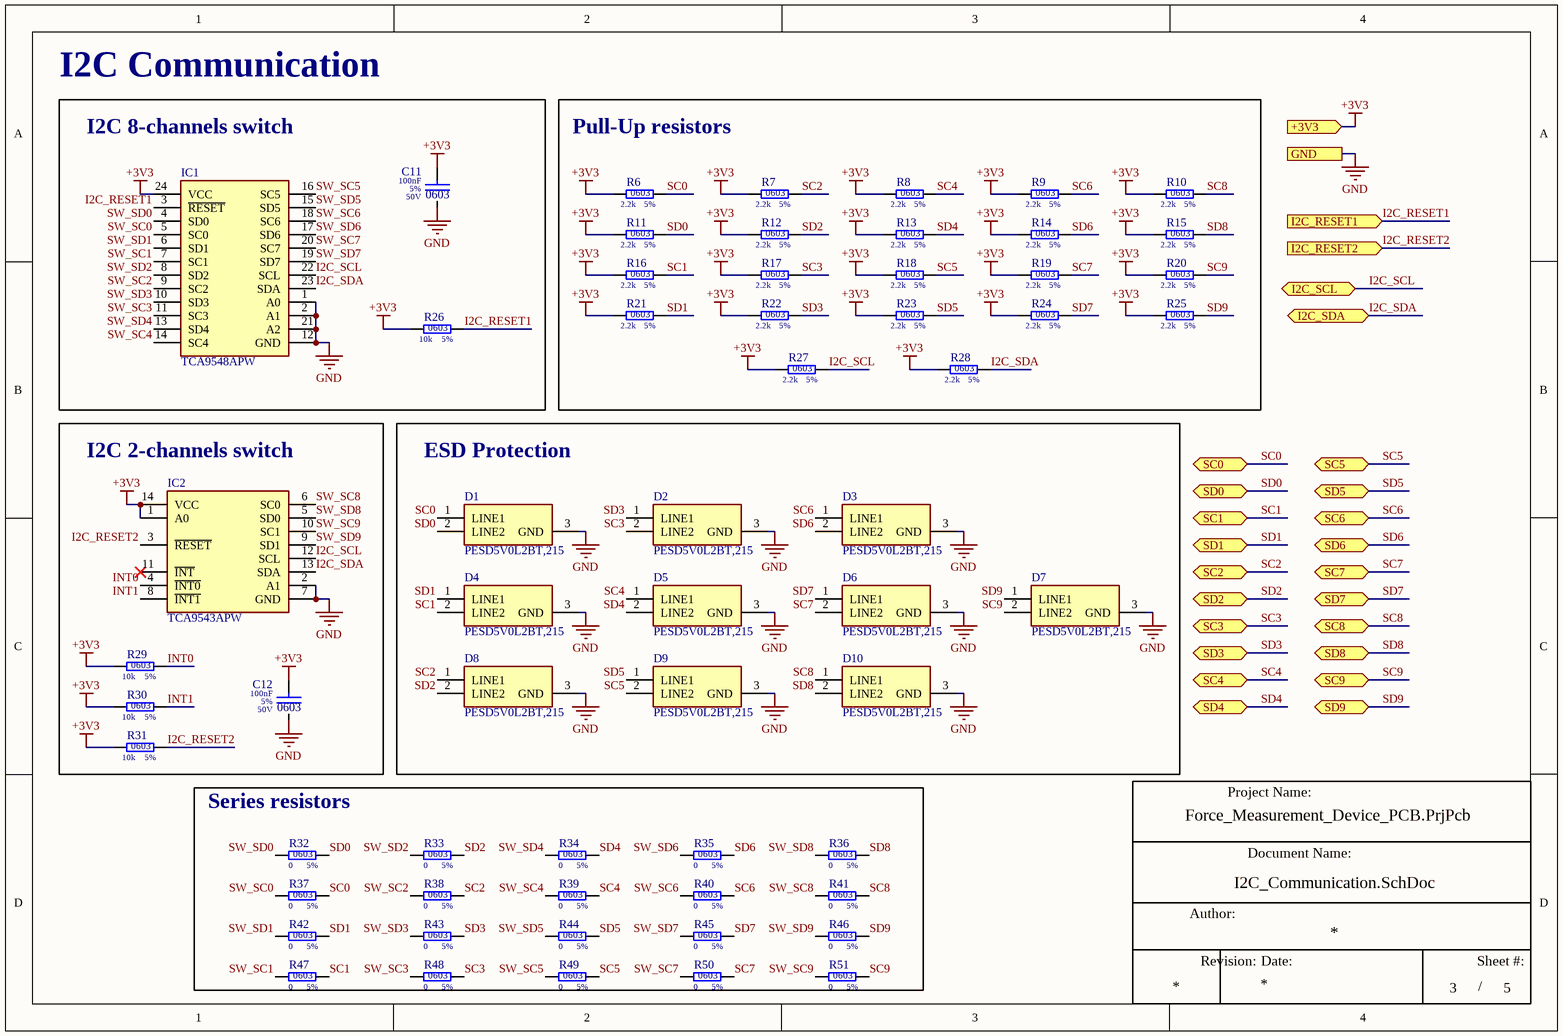
[diagram p4: I2C_Communication.SchDoc]

### Parts
C11  value 100nF  Tolerance: 5%  Voltage Rating: 50V  Case/Package: 0603  [0603_Capacitor]  (hidden comment: C_100n_50V_0603_5)
C12  value 100nF  Tolerance: 5%  Voltage Rating: 50V  Case/Package: 0603  [0603_Capacitor]  (hidden comment: C_100n_50V_0603_5)
D1  PESD5V0L2BT,215  [SOT95P230X110-3N]
D2  PESD5V0L2BT,215  [SOT95P230X110-3N]
D3  PESD5V0L2BT,215  [SOT95P230X110-3N]
D4  PESD5V0L2BT,215  [SOT95P230X110-3N]
D5  PESD5V0L2BT,215  [SOT95P230X110-3N]
D6  PESD5V0L2BT,215  [SOT95P230X110-3N]
D7  PESD5V0L2BT,215  [SOT95P230X110-3N]
D8  PESD5V0L2BT,215  [SOT95P230X110-3N]
D9  PESD5V0L2BT,215  [SOT95P230X110-3N]
D10  PESD5V0L2BT,215  [SOT95P230X110-3N]
IC1  TCA9548APW  [SOP65P640X120-24N]
IC2  TCA9543APW  [SOP65P640X120-14N]
R6  Tolerance: 5%  Resistance: 2.2k  Case/Package: 0603  [0603_Resistor]  (hidden comment: R_2.2k_0603_5)
R7  Tolerance: 5%  Resistance: 2.2k  Case/Package: 0603  [0603_Resistor]  (hidden comment: R_2.2k_0603_5)
R8  Tolerance: 5%  Resistance: 2.2k  Case/Package: 0603  [0603_Resistor]  (hidden comment: R_2.2k_0603_5)
R9  Tolerance: 5%  Resistance: 2.2k  Case/Package: 0603  [0603_Resistor]  (hidden comment: R_2.2k_0603_5)
R10  Tolerance: 5%  Resistance: 2.2k  Case/Package: 0603  [0603_Resistor]  (hidden comment: R_2.2k_0603_5)
R11  Tolerance: 5%  Resistance: 2.2k  Case/Package: 0603  [0603_Resistor]  (hidden comment: R_2.2k_0603_5)
R12  Tolerance: 5%  Resistance: 2.2k  Case/Package: 0603  [0603_Resistor]  (hidden comment: R_2.2k_0603_5)
R13  Tolerance: 5%  Resistance: 2.2k  Case/Package: 0603  [0603_Resistor]  (hidden comment: R_2.2k_0603_5)
R14  Tolerance: 5%  Resistance: 2.2k  Case/Package: 0603  [0603_Resistor]  (hidden comment: R_2.2k_0603_5)
R15  Tolerance: 5%  Resistance: 2.2k  Case/Package: 0603  [0603_Resistor]  (hidden comment: R_2.2k_0603_5)
R16  Tolerance: 5%  Resistance: 2.2k  Case/Package: 0603  [0603_Resistor]  (hidden comment: R_2.2k_0603_5)
R17  Tolerance: 5%  Resistance: 2.2k  Case/Package: 0603  [0603_Resistor]  (hidden comment: R_2.2k_0603_5)
R18  Tolerance: 5%  Resistance: 2.2k  Case/Package: 0603  [0603_Resistor]  (hidden comment: R_2.2k_0603_5)
R19  Tolerance: 5%  Resistance: 2.2k  Case/Package: 0603  [0603_Resistor]  (hidden comment: R_2.2k_0603_5)
R20  Tolerance: 5%  Resistance: 2.2k  Case/Package: 0603  [0603_Resistor]  (hidden comment: R_2.2k_0603_5)
R21  Tolerance: 5%  Resistance: 2.2k  Case/Package: 0603  [0603_Resistor]  (hidden comment: R_2.2k_0603_5)
R22  Tolerance: 5%  Resistance: 2.2k  Case/Package: 0603  [0603_Resistor]  (hidden comment: R_2.2k_0603_5)
R23  Tolerance: 5%  Resistance: 2.2k  Case/Package: 0603  [0603_Resistor]  (hidden comment: R_2.2k_0603_5)
R24  Tolerance: 5%  Resistance: 2.2k  Case/Package: 0603  [0603_Resistor]  (hidden comment: R_2.2k_0603_5)
R25  Tolerance: 5%  Resistance: 2.2k  Case/Package: 0603  [0603_Resistor]  (hidden comment: R_2.2k_0603_5)
R26  Tolerance: 5%  Resistance: 10k  Case/Package: 0603  [0603_Resistor]  (hidden comment: R_10k_0603_5)
R27  Tolerance: 5%  Resistance: 2.2k  Case/Package: 0603  [0603_Resistor]  (hidden comment: R_2.2k_0603_5)
R28  Tolerance: 5%  Resistance: 2.2k  Case/Package: 0603  [0603_Resistor]  (hidden comment: R_2.2k_0603_5)
R29  Tolerance: 5%  Resistance: 10k  Case/Package: 0603  [0603_Resistor]  (hidden comment: R_10k_0603_5)
R30  Tolerance: 5%  Resistance: 10k  Case/Package: 0603  [0603_Resistor]  (hidden comment: R_10k_0603_5)
R31  Tolerance: 5%  Resistance: 10k  Case/Package: 0603  [0603_Resistor]  (hidden comment: R_10k_0603_5)
R32  Tolerance: 5%  Resistance: 0  Case/Package: 0603  [0603_Resistor]  (hidden comment: R_0_0603_5)
R33  Tolerance: 5%  Resistance: 0  Case/Package: 0603  [0603_Resistor]  (hidden comment: R_0_0603_5)
R34  Tolerance: 5%  Resistance: 0  Case/Package: 0603  [0603_Resistor]  (hidden comment: R_0_0603_5)
R35  Tolerance: 5%  Resistance: 0  Case/Package: 0603  [0603_Resistor]  (hidden comment: R_0_0603_5)
R36  Tolerance: 5%  Resistance: 0  Case/Package: 0603  [0603_Resistor]  (hidden comment: R_0_0603_5)
R37  Tolerance: 5%  Resistance: 0  Case/Package: 0603  [0603_Resistor]  (hidden comment: R_0_0603_5)
R38  Tolerance: 5%  Resistance: 0  Case/Package: 0603  [0603_Resistor]  (hidden comment: R_0_0603_5)
R39  Tolerance: 5%  Resistance: 0  Case/Package: 0603  [0603_Resistor]  (hidden comment: R_0_0603_5)
R40  Tolerance: 5%  Resistance: 0  Case/Package: 0603  [0603_Resistor]  (hidden comment: R_0_0603_5)
R41  Tolerance: 5%  Resistance: 0  Case/Package: 0603  [0603_Resistor]  (hidden comment: R_0_0603_5)
R42  Tolerance: 5%  Resistance: 0  Case/Package: 0603  [0603_Resistor]  (hidden comment: R_0_0603_5)
R43  Tolerance: 5%  Resistance: 0  Case/Package: 0603  [0603_Resistor]  (hidden comment: R_0_0603_5)
R44  Tolerance: 5%  Resistance: 0  Case/Package: 0603  [0603_Resistor]  (hidden comment: R_0_0603_5)
R45  Tolerance: 5%  Resistance: 0  Case/Package: 0603  [0603_Resistor]  (hidden comment: R_0_0603_5)
R46  Tolerance: 5%  Resistance: 0  Case/Package: 0603  [0603_Resistor]  (hidden comment: R_0_0603_5)
R47  Tolerance: 5%  Resistance: 0  Case/Package: 0603  [0603_Resistor]  (hidden comment: R_0_0603_5)
R48  Tolerance: 5%  Resistance: 0  Case/Package: 0603  [0603_Resistor]  (hidden comment: R_0_0603_5)
R49  Tolerance: 5%  Resistance: 0  Case/Package: 0603  [0603_Resistor]  (hidden comment: R_0_0603_5)
R50  Tolerance: 5%  Resistance: 0  Case/Package: 0603  [0603_Resistor]  (hidden comment: R_0_0603_5)
R51  Tolerance: 5%  Resistance: 0  Case/Package: 0603  [0603_Resistor]  (hidden comment: R_0_0603_5)

### Blocks framed on the sheet
I2C Communication: C11 IC1 R26
Pull-Up resistors: R6-R25 R27 R28
I2C 2-channels switch: C12 IC2 R29-R31
ESD Protection: D1-D10
Series resistors: R32-R51

### Ports
+3V3 (in), GND, I2C_RESET1 (in), I2C_RESET2 (in), I2C_SCL (bidir), I2C_SDA (bidir), SC0 (bidir), SC1 (bidir), SC2 (bidir), SC3 (bidir), SC4 (bidir), SC5 (bidir), SC6 (bidir), SC7 (bidir), SC8 (bidir), SC9 (bidir), SD0 (bidir), SD1 (bidir), SD2 (bidir), SD3 (bidir), SD4 (bidir), SD5 (bidir), SD6 (bidir), SD7 (bidir), SD8 (bidir), SD9 (bidir)

### Nets
+3V3: C11.1 C12.1 IC1.24(VCC) IC2.1(A0) IC2.14(VCC) R6.1 R7.1 R8.1 R9.1 R10.1 R11.1 R12.1 R13.1 R14.1 R15.1 R16.1 R17.1 R18.1 R19.1 R20.1 R21.1 R22.1 R23.1 R24.1 R25.1 R26.1 R27.1 R28.1 R29.1 R30.1 R31.1 ; port +3V3
GND: C11.2 C12.2 D1.3(GND) D2.3(GND) D3.3(GND) D4.3(GND) D5.3(GND) D6.3(GND) D7.3(GND) D8.3(GND) D9.3(GND) D10.3(GND) IC1.1(A0) IC1.2(A1) IC1.12(GND) IC1.21(A2) IC2.2(A1) IC2.7(GND) ; port GND
I2C_RESET1: IC1.3(~{RESET}) R26.2 ; port I2C_RESET1
I2C_RESET2: IC2.3(~{RESET}) R31.2 ; port I2C_RESET2
I2C_SCL: IC1.22(SCL) IC2.12(SCL) R27.2 ; port I2C_SCL
I2C_SDA: IC1.23(SDA) IC2.13(SDA) R28.2 ; port I2C_SDA
INT0: IC2.4(~{INT0}) R29.2
INT1: IC2.8(~{INT1}) R30.2
SC0: D1.1(LINE1) R6.2 R37.2 ; port SC0
SC1: D4.2(LINE2) R16.2 R47.2 ; port SC1
SC2: D8.1(LINE1) R7.2 R38.2 ; port SC2
SC3: D2.2(LINE2) R17.2 R48.2 ; port SC3
SC4: D5.1(LINE1) R8.2 R39.2 ; port SC4
SC5: D9.2(LINE2) R18.2 R49.2 ; port SC5
SC6: D3.1(LINE1) R9.2 R40.2 ; port SC6
SC7: D6.2(LINE2) R19.2 R50.2 ; port SC7
SC8: D10.1(LINE1) R10.2 R41.2 ; port SC8
SC9: D7.2(LINE2) R20.2 R51.2 ; port SC9
SD0: D1.2(LINE2) R11.2 R32.2 ; port SD0
SD1: D4.1(LINE1) R21.2 R42.2 ; port SD1
SD2: D8.2(LINE2) R12.2 R33.2 ; port SD2
SD3: D2.1(LINE1) R22.2 R43.2 ; port SD3
SD4: D5.2(LINE2) R13.2 R34.2 ; port SD4
SD5: D9.1(LINE1) R23.2 R44.2 ; port SD5
SD6: D3.2(LINE2) R14.2 R35.2 ; port SD6
SD7: D6.1(LINE1) R24.2 R45.2 ; port SD7
SD8: D10.2(LINE2) R15.2 R36.2 ; port SD8
SD9: D7.1(LINE1) R25.2 R46.2 ; port SD9
SW_SC0: IC1.5(SC0) R37.1
SW_SC1: IC1.7(SC1) R47.1
SW_SC2: IC1.9(SC2) R38.1
SW_SC3: IC1.11(SC3) R48.1
SW_SC4: IC1.14(SC4) R39.1
SW_SC5: IC1.16(SC5) R49.1
SW_SC6: IC1.18(SC6) R40.1
SW_SC7: IC1.20(SC7) R50.1
SW_SC8: IC2.6(SC0) R41.1
SW_SC9: IC2.10(SC1) R51.1
SW_SD0: IC1.4(SD0) R32.1
SW_SD1: IC1.6(SD1) R42.1
SW_SD2: IC1.8(SD2) R33.1
SW_SD3: IC1.10(SD3) R43.1
SW_SD4: IC1.13(SD4) R34.1
SW_SD5: IC1.15(SD5) R44.1
SW_SD6: IC1.17(SD6) R35.1
SW_SD7: IC1.19(SD7) R45.1
SW_SD8: IC2.5(SD0) R36.1
SW_SD9: IC2.9(SD1) R46.1

Not connected (* = marked no-connect by the designer): IC2 11(~{INT})*

### Notes on the sheet
- I2C 8-channels switch
- Project Name:
- Author:
- Document Name:
- Revision:
- Date:
- Sheet #:
- /

### Library data of the parts
C11 C12 = CMP-001-00008-27: as C13 on sheet Force_Sensors; HelpURL: https://www.tme.eu/Document/78f46414e6dac38b7cca12338ea208b0/X7RDielectric.pdf; Mounting Technology: SMT
D1-D10 = PESD5V0L2BT,215: Diode ESD (Bi-directional); Manufacturer_Name: Nexperia; Datasheet Link: https://assets.nexperia.com/documents/data-sheet/PESDXL2BT_SER.pdf; Height: 1.1mm; Manufacturer_Part_Number: PESD5V0L2BT,215; Mouser Part Number: 771-PESD5V0L2BT-T/R; Mouser Price/Stock: https://www.mouser.co.uk/ProductDetail/Nexperia/PESD5V0L2BT215?qs=LOCUfHb8d9sw%252B%2FcZzpNtzw%3D%3D; Arrow Part Number: PESD5V0L2BT,215; Arrow Price/Stock: https://www.arrow.com/en/products/pesd5v0l2bt215/nexperia?utm_currency=USD&region=nac
IC1 = TCA9548APW: Integrated Circuit; Manufacturer_Name: Texas Instruments; Datasheet Link: http://www.ti.com/lit/ds/symlink/tca9548a.pdf; Height: 1.2mm; Manufacturer_Part_Number: TCA9548APW
IC2 = TCA9543APW: Integrated Circuit; Manufacturer_Name: Texas Instruments; Datasheet Link: https://www.ti.com/lit/ds/symlink/tca9543a.pdf?ts=1706191605881&ref_url=https%253A%252F%252Fwww.ti.com%252Fproduct%252FTCA9543A%252Fpart-details%252FTCA9543APWR; Height: 1.2mm; Manufacturer_Part_Number: TCA9543APW
R6-R25 R27 R28 = CMP-009-00054-14: Revision Num.: 1; Voltage Rating: 50V; Power: 100mW; Mounting Technology: SMT; HelpURL: https://www.mouser.pl/datasheet/2/315/AOA0000C334-1314047.pdf
R26 R29-R31 = CMP-009-00002-21: as R5 on sheet MCU; Mounting Technology: SMT; HelpURL: https://www.tme.eu/Document/d2a72e545e5c8eb7bf2a04fa97535928/rc0603yageo.pdf
R32-R51 = CMP-009-00016-20: as R2 on sheet MCU; Mounting Technology: SMT; HelpURL: https://www.tme.eu/Document/c283990e907c122bb808207d1578ac7f/POWER_RATING-DTE.pdf

## Nets that join several sheets
+3V3: Main (J12.3), Force_Sensors (20 pins), Power_Supply_USB (C24.1 IC4.1 IC4.2 R53.2), MCU (15 pins), I2C_Communication (31 pins)
GND: Main (J12.4), Force_Sensors (20 pins), Power_Supply_USB (17 pins), MCU (18 pins), I2C_Communication (18 pins)
I2C_RESET1: MCU (UP1.19), I2C_Communication (IC1.3 R26.2)
I2C_RESET2: MCU (UP1.18), I2C_Communication (IC2.3 R31.2)
I2C_SCL: MCU (R3.1), I2C_Communication (IC1.22 IC2.12 R27.2)
I2C_SDA: MCU (R2.1), I2C_Communication (IC1.23 IC2.13 R28.2)
MCU_USB_N: Power_Supply_USB (IC3.4), MCU (UP1.32)
MCU_USB_P: Power_Supply_USB (IC3.3), MCU (UP1.33)
SC0: Force_Sensors (J1.2), I2C_Communication (D1.1 R6.2 R37.2)
SC1: Force_Sensors (J2.3), I2C_Communication (D4.2 R16.2 R47.2)
SC2: Force_Sensors (J3.2), I2C_Communication (D8.1 R7.2 R38.2)
SC3: Force_Sensors (J4.3), I2C_Communication (D2.2 R17.2 R48.2)
SC4: Force_Sensors (J5.2), I2C_Communication (D5.1 R8.2 R39.2)
SC5: Force_Sensors (J6.3), I2C_Communication (D9.2 R18.2 R49.2)
SC6: Force_Sensors (J7.2), I2C_Communication (D3.1 R9.2 R40.2)
SC7: Force_Sensors (J8.3), I2C_Communication (D6.2 R19.2 R50.2)
SC8: Force_Sensors (J9.2), I2C_Communication (D10.1 R10.2 R41.2)
SC9: Force_Sensors (J10.3), I2C_Communication (D7.2 R20.2 R51.2)
SD0: Force_Sensors (J1.3), I2C_Communication (D1.2 R11.2 R32.2)
SD1: Force_Sensors (J2.2), I2C_Communication (D4.1 R21.2 R42.2)
SD2: Force_Sensors (J3.3), I2C_Communication (D8.2 R12.2 R33.2)
SD3: Force_Sensors (J4.2), I2C_Communication (D2.1 R22.2 R43.2)
SD4: Force_Sensors (J5.3), I2C_Communication (D5.2 R13.2 R34.2)
SD5: Force_Sensors (J6.2), I2C_Communication (D9.1 R23.2 R44.2)
SD6: Force_Sensors (J7.3), I2C_Communication (D3.2 R14.2 R35.2)
SD7: Force_Sensors (J8.2), I2C_Communication (D6.1 R24.2 R45.2)
SD8: Force_Sensors (J9.3), I2C_Communication (D10.2 R15.2 R36.2)
SD9: Force_Sensors (J10.2), I2C_Communication (D7.1 R25.2 R46.2)
SYS_SWCLK: Main (J12.1), MCU (UP1.37)
SYS_SWDIO: Main (J12.2), MCU (UP1.34)